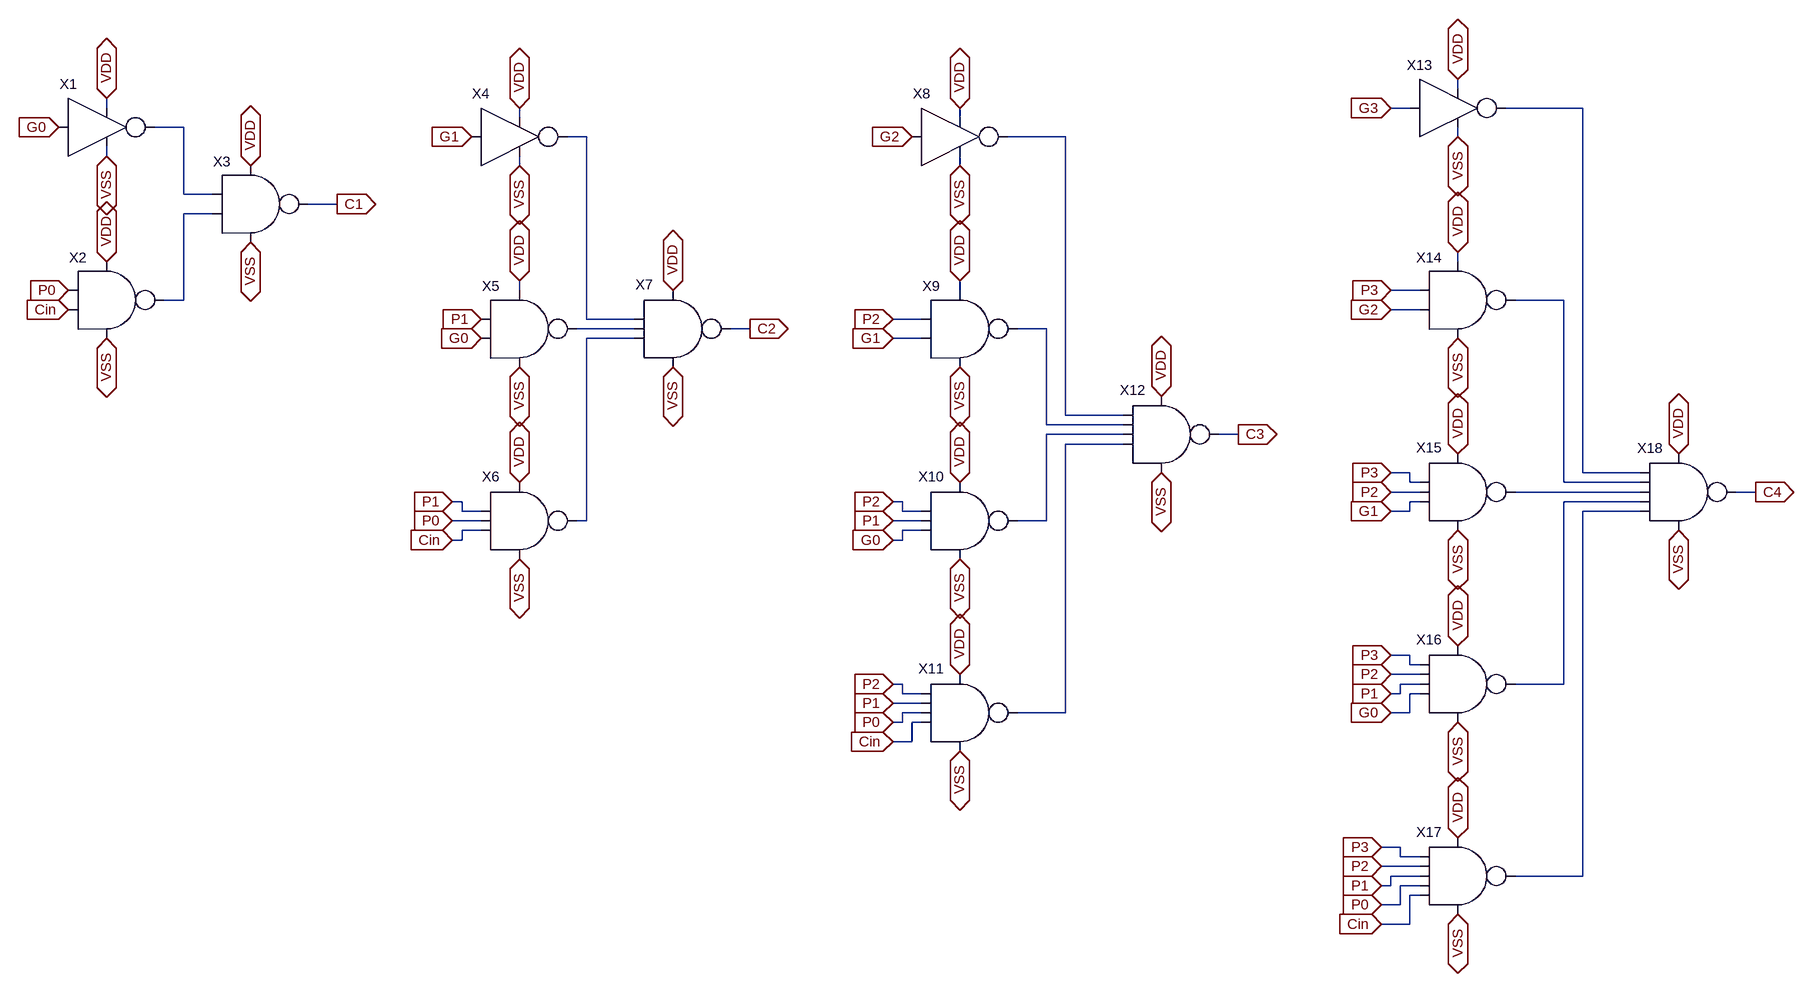
[diagram p0: schematic CLA_ADDER.asc]
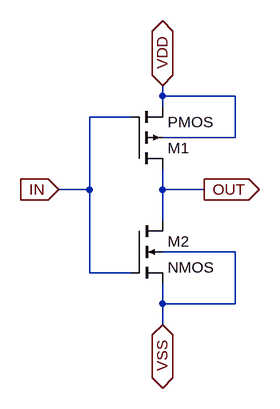
[diagram p1: sub-circuit inverter.asc]
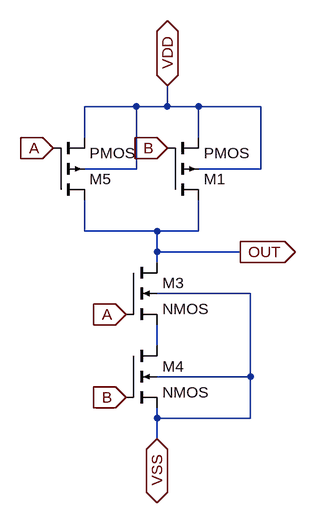
[diagram p2: sub-circuit nand2.asc]
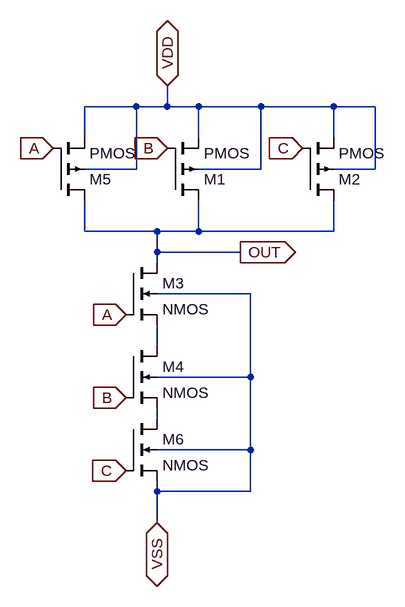
[diagram p3: sub-circuit nand3.asc]
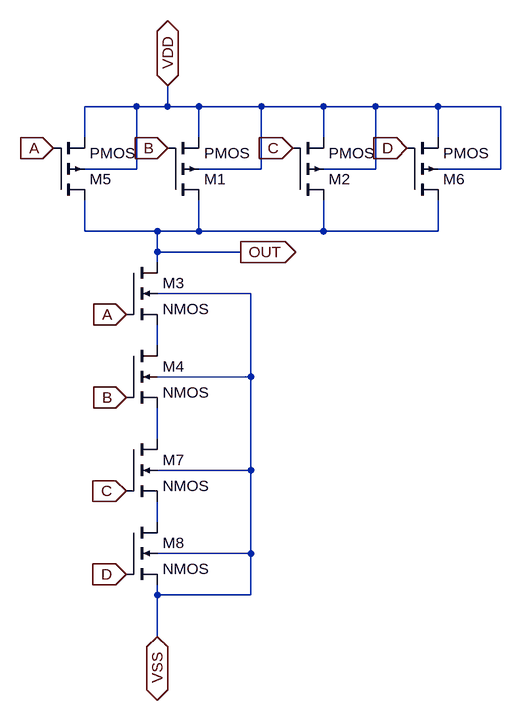
[diagram p4: sub-circuit nand4.asc]
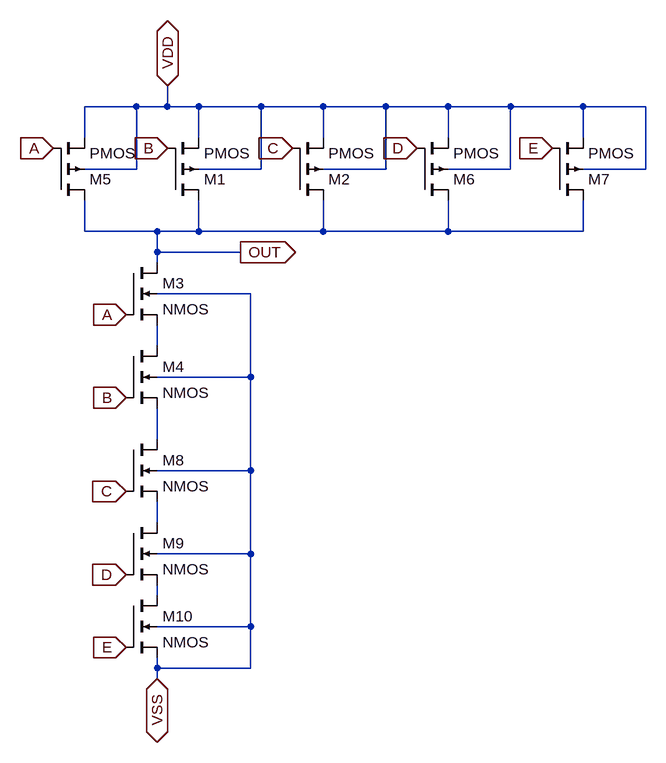
[diagram p5: sub-circuit nand5.asc]
CLA_ADDER.asc, the LTspice schematic file:
Version 4.1
SHEET 1 3272 1288
WIRE 2640 -192 2640 -208
WIRE 64 -160 64 -176
WIRE 2560 -160 2528 -160
WIRE 2848 -160 2720 -160
WIRE 752 -144 752 -160
WIRE 1648 -144 1648 -160
WIRE 192 -128 144 -128
WIRE 864 -112 832 -112
WIRE 1824 -112 1728 -112
WIRE 2640 -112 2640 -128
WIRE 64 -80 64 -96
WIRE 752 -64 752 -80
WIRE 1648 -64 1648 -80
WIRE 192 -16 192 -128
WIRE 240 -16 192 -16
WIRE 448 0 400 0
WIRE 240 16 192 16
WIRE 2640 96 2640 80
WIRE 752 144 752 128
WIRE 1648 144 1648 128
WIRE 2576 144 2528 144
WIRE 192 160 192 16
WIRE 192 160 160 160
WIRE 2816 160 2736 160
WIRE 2576 176 2528 176
WIRE 864 192 864 -112
WIRE 944 192 864 192
WIRE 1584 192 1536 192
WIRE 944 208 848 208
WIRE 1136 208 1104 208
WIRE 1792 208 1744 208
WIRE 944 224 864 224
WIRE 1584 224 1536 224
WIRE 1824 352 1824 -112
WIRE 1920 352 1824 352
WIRE 1792 368 1792 208
WIRE 1920 368 1792 368
WIRE 1920 384 1792 384
WIRE 2112 384 2080 384
WIRE 1920 400 1824 400
WIRE 2560 448 2528 448
WIRE 2848 448 2848 -160
WIRE 2944 448 2848 448
WIRE 2560 464 2560 448
WIRE 2576 464 2560 464
WIRE 2816 464 2816 160
WIRE 2944 464 2816 464
WIRE 2576 480 2528 480
WIRE 2944 480 2736 480
WIRE 3136 480 3104 480
WIRE 656 496 640 496
WIRE 1552 496 1536 496
WIRE 2576 496 2560 496
WIRE 2944 496 2816 496
WIRE 656 512 656 496
WIRE 688 512 656 512
WIRE 1552 512 1552 496
WIRE 1584 512 1552 512
WIRE 2560 512 2560 496
WIRE 2560 512 2528 512
WIRE 2944 512 2848 512
WIRE 688 528 640 528
WIRE 864 528 864 224
WIRE 864 528 848 528
WIRE 1584 528 1536 528
WIRE 1792 528 1792 384
WIRE 1792 528 1744 528
WIRE 688 544 656 544
WIRE 1584 544 1552 544
WIRE 656 560 656 544
WIRE 656 560 640 560
WIRE 1552 560 1552 544
WIRE 1552 560 1536 560
WIRE 2560 752 2528 752
WIRE 2560 768 2560 752
WIRE 2576 768 2560 768
WIRE 2576 784 2528 784
WIRE 1552 800 1536 800
WIRE 2576 800 2544 800
WIRE 2816 800 2816 496
WIRE 2816 800 2736 800
WIRE 1552 816 1552 800
WIRE 1584 816 1552 816
WIRE 2544 816 2544 800
WIRE 2544 816 2528 816
WIRE 2576 816 2560 816
WIRE 1584 832 1536 832
WIRE 1584 848 1552 848
WIRE 1824 848 1824 400
WIRE 1824 848 1744 848
WIRE 2560 848 2560 816
WIRE 2560 848 2528 848
WIRE 1552 864 1552 848
WIRE 1552 864 1536 864
WIRE 1584 864 1568 864
WIRE 1568 896 1568 864
WIRE 1568 896 1536 896
WIRE 2544 1072 2512 1072
WIRE 2544 1088 2544 1072
WIRE 2576 1088 2544 1088
WIRE 2576 1104 2512 1104
WIRE 2576 1120 2528 1120
WIRE 2848 1120 2848 512
WIRE 2848 1120 2736 1120
WIRE 2528 1136 2528 1120
WIRE 2528 1136 2512 1136
WIRE 2576 1136 2544 1136
WIRE 2576 1152 2560 1152
WIRE 2544 1168 2544 1136
WIRE 2544 1168 2512 1168
WIRE 2560 1200 2560 1152
WIRE 2560 1200 2512 1200
FLAG 64 -176 VDD
IOPIN 64 -176 BiDir
FLAG 64 96 VDD
IOPIN 64 96 BiDir
FLAG 304 -64 VDD
IOPIN 304 -64 BiDir
FLAG 304 64 VSS
IOPIN 304 64 BiDir
FLAG 64 224 VSS
IOPIN 64 224 BiDir
FLAG 64 -80 VSS
IOPIN 64 -80 BiDir
FLAG 752 -160 VDD
IOPIN 752 -160 BiDir
FLAG 752 128 VDD
IOPIN 752 128 BiDir
FLAG 752 464 VDD
IOPIN 752 464 BiDir
FLAG 752 -64 VSS
IOPIN 752 -64 BiDir
FLAG 752 272 VSS
IOPIN 752 272 BiDir
FLAG 752 592 VSS
IOPIN 752 592 BiDir
FLAG 1008 144 VDD
IOPIN 1008 144 BiDir
FLAG 1008 272 VSS
IOPIN 1008 272 BiDir
FLAG 1648 -160 VDD
IOPIN 1648 -160 BiDir
FLAG 1648 128 VDD
IOPIN 1648 128 BiDir
FLAG 1648 464 VDD
IOPIN 1648 464 BiDir
FLAG 1648 -64 VSS
IOPIN 1648 -64 BiDir
FLAG 1648 272 VSS
IOPIN 1648 272 BiDir
FLAG 1648 592 VSS
IOPIN 1648 592 BiDir
FLAG 1648 784 VDD
IOPIN 1648 784 BiDir
FLAG 1648 912 VSS
IOPIN 1648 912 BiDir
FLAG 1984 320 VDD
IOPIN 1984 320 BiDir
FLAG 1984 448 VSS
IOPIN 1984 448 BiDir
FLAG 2640 -208 VDD
IOPIN 2640 -208 BiDir
FLAG 2640 80 VDD
IOPIN 2640 80 BiDir
FLAG 2640 416 VDD
IOPIN 2640 416 BiDir
FLAG 2640 -112 VSS
IOPIN 2640 -112 BiDir
FLAG 2640 224 VSS
IOPIN 2640 224 BiDir
FLAG 2640 544 VSS
IOPIN 2640 544 BiDir
FLAG 2640 736 VDD
IOPIN 2640 736 BiDir
FLAG 2640 864 VSS
IOPIN 2640 864 BiDir
FLAG 2640 1056 VDD
IOPIN 2640 1056 BiDir
FLAG 2640 1184 VSS
IOPIN 2640 1184 BiDir
FLAG 3008 416 VDD
IOPIN 3008 416 BiDir
FLAG 3008 544 VSS
IOPIN 3008 544 BiDir
FLAG -16 -128 G0
IOPIN -16 -128 In
FLAG 0 144 P0
IOPIN 0 144 In
FLAG 0 176 Cin
IOPIN 0 176 In
FLAG 448 0 C1
IOPIN 448 0 Out
FLAG 1136 208 C2
IOPIN 1136 208 Out
FLAG 2112 384 C3
IOPIN 2112 384 Out
FLAG 3136 480 C4
IOPIN 3136 480 Out
FLAG 672 -112 G1
IOPIN 672 -112 In
FLAG 688 192 P1
IOPIN 688 192 In
FLAG 688 224 G0
IOPIN 688 224 In
FLAG 640 496 P1
IOPIN 640 496 In
FLAG 640 528 P0
IOPIN 640 528 In
FLAG 640 560 Cin
IOPIN 640 560 In
FLAG 1536 496 P2
IOPIN 1536 496 In
FLAG 1536 528 P1
IOPIN 1536 528 In
FLAG 1536 560 G0
IOPIN 1536 560 In
FLAG 1536 832 P1
IOPIN 1536 832 In
FLAG 1536 864 P0
IOPIN 1536 864 In
FLAG 1536 896 Cin
IOPIN 1536 896 In
FLAG 1536 800 P2
IOPIN 1536 800 In
FLAG 1536 192 P2
IOPIN 1536 192 In
FLAG 1536 224 G1
IOPIN 1536 224 In
FLAG 1568 -112 G2
IOPIN 1568 -112 In
FLAG 2528 448 P3
IOPIN 2528 448 In
FLAG 2528 480 P2
IOPIN 2528 480 In
FLAG 2528 512 G1
IOPIN 2528 512 In
FLAG 2528 784 P2
IOPIN 2528 784 In
FLAG 2528 816 P1
IOPIN 2528 816 In
FLAG 2528 848 G0
IOPIN 2528 848 In
FLAG 2528 752 P3
IOPIN 2528 752 In
FLAG 2528 144 P3
IOPIN 2528 144 In
FLAG 2528 176 G2
IOPIN 2528 176 In
FLAG 2528 -160 G3
IOPIN 2528 -160 In
FLAG 2512 1104 P2
IOPIN 2512 1104 In
FLAG 2512 1136 P1
IOPIN 2512 1136 In
FLAG 2512 1168 P0
IOPIN 2512 1168 In
FLAG 2512 1072 P3
IOPIN 2512 1072 In
FLAG 2512 1200 Cin
IOPIN 2512 1200 In
SYMBOL INVERTER 48 -128 R0
SYMATTR InstName X1
SYMBOL NAND2 64 160 R0
SYMATTR InstName X2
SYMBOL NAND2 304 0 R0
SYMATTR InstName X3
SYMBOL INVERTER 736 -112 R0
SYMATTR InstName X4
SYMBOL NAND2 752 208 R0
SYMATTR InstName X5
SYMBOL NAND3 752 528 R0
SYMATTR InstName X6
SYMBOL NAND3 1008 208 R0
SYMATTR InstName X7
SYMBOL INVERTER 1632 -112 R0
SYMATTR InstName X8
SYMBOL NAND2 1648 208 R0
SYMATTR InstName X9
SYMBOL NAND3 1648 528 R0
SYMATTR InstName X10
SYMBOL NAND4 1648 848 R0
SYMATTR InstName X11
SYMBOL NAND4 1984 384 R0
SYMATTR InstName X12
SYMBOL INVERTER 2624 -160 R0
SYMATTR InstName X13
SYMBOL NAND2 2640 160 R0
SYMATTR InstName X14
SYMBOL NAND3 2640 480 R0
SYMATTR InstName X15
SYMBOL NAND4 2640 800 R0
SYMATTR InstName X16
SYMBOL NAND5 2640 1120 R0
SYMATTR InstName X17
SYMBOL NAND5 3008 480 R0
SYMATTR InstName X18

inverter.asc, the sub-circuit schematic file:
Version 4.1
SHEET 1 880 680
WIRE 240 -272 240 -288
WIRE 352 -272 240 -272
WIRE 240 -256 240 -272
WIRE 192 -240 128 -240
WIRE 352 -208 352 -272
WIRE 352 -208 240 -208
WIRE 128 -128 128 -240
WIRE 128 -128 80 -128
WIRE 240 -128 240 -160
WIRE 304 -128 240 -128
WIRE 240 -80 240 -128
WIRE 352 -32 240 -32
WIRE 128 0 128 -128
WIRE 192 0 128 0
WIRE 240 48 240 16
WIRE 352 48 352 -32
WIRE 352 48 240 48
WIRE 240 80 240 48
FLAG 240 -288 VDD
IOPIN 240 -288 BiDir
FLAG 80 -128 IN
IOPIN 80 -128 In
FLAG 304 -128 OUT
IOPIN 304 -128 Out
FLAG 240 80 VSS
IOPIN 240 80 BiDir
SYMBOL pmos4 192 -160 M180
SYMATTR InstName M1
SYMBOL nmos4 192 -80 R0
SYMATTR InstName M2

nand2.asc, the sub-circuit schematic file:
Version 4.1
SHEET 1 880 680
WIRE 160 -688 80 -688
WIRE 208 -688 208 -720
WIRE 208 -688 160 -688
WIRE 256 -688 208 -688
WIRE 352 -688 256 -688
WIRE 80 -640 80 -688
WIRE 256 -640 256 -688
WIRE 160 -592 160 -688
WIRE 160 -592 80 -592
WIRE 352 -592 352 -688
WIRE 352 -592 256 -592
WIRE 80 -496 80 -544
WIRE 192 -496 80 -496
WIRE 256 -496 256 -544
WIRE 256 -496 192 -496
WIRE 192 -464 192 -496
WIRE 320 -464 192 -464
WIRE 192 -448 192 -464
WIRE 336 -400 192 -400
WIRE 192 -320 192 -352
WIRE 336 -272 336 -400
WIRE 336 -272 192 -272
WIRE 192 -208 192 -224
WIRE 336 -208 336 -272
WIRE 336 -208 192 -208
WIRE 192 -176 192 -208
FLAG 208 -720 VDD
IOPIN 208 -720 BiDir
FLAG 192 -176 VSS
IOPIN 192 -176 BiDir
FLAG 32 -624 A
IOPIN 32 -624 In
FLAG 208 -624 B
IOPIN 208 -624 In
FLAG 144 -368 A
IOPIN 144 -368 In
FLAG 144 -240 B
IOPIN 144 -240 In
FLAG 320 -464 OUT
IOPIN 320 -464 Out
SYMBOL nmos4 144 -448 R0
SYMATTR InstName M3
SYMBOL nmos4 144 -320 R0
SYMATTR InstName M4
SYMBOL pmos4 32 -544 M180
SYMATTR InstName M5
SYMBOL pmos4 208 -544 M180
SYMATTR InstName M1

nand3.asc, the sub-circuit schematic file:
Version 4.1
SHEET 1 880 680
WIRE 160 -688 80 -688
WIRE 208 -688 208 -720
WIRE 208 -688 160 -688
WIRE 256 -688 208 -688
WIRE 352 -688 256 -688
WIRE 464 -688 352 -688
WIRE 528 -688 464 -688
WIRE 80 -640 80 -688
WIRE 256 -640 256 -688
WIRE 464 -640 464 -688
WIRE 160 -592 160 -688
WIRE 160 -592 80 -592
WIRE 352 -592 352 -688
WIRE 352 -592 256 -592
WIRE 528 -592 528 -688
WIRE 528 -592 464 -592
WIRE 80 -496 80 -544
WIRE 192 -496 80 -496
WIRE 256 -496 256 -544
WIRE 256 -496 192 -496
WIRE 464 -496 464 -544
WIRE 464 -496 256 -496
WIRE 192 -464 192 -496
WIRE 320 -464 192 -464
WIRE 192 -448 192 -464
WIRE 336 -400 192 -400
WIRE 192 -320 192 -352
WIRE 336 -272 336 -400
WIRE 336 -272 192 -272
WIRE 192 -208 192 -224
WIRE 336 -160 336 -272
WIRE 336 -160 192 -160
WIRE 192 -96 192 -112
WIRE 336 -96 336 -160
WIRE 336 -96 192 -96
WIRE 192 -48 192 -96
FLAG 208 -720 VDD
IOPIN 208 -720 BiDir
FLAG 192 -48 VSS
IOPIN 192 -48 BiDir
FLAG 32 -624 A
IOPIN 32 -624 In
FLAG 208 -624 B
IOPIN 208 -624 In
FLAG 144 -368 A
IOPIN 144 -368 In
FLAG 144 -240 B
IOPIN 144 -240 In
FLAG 320 -464 OUT
IOPIN 320 -464 Out
FLAG 416 -624 C
IOPIN 416 -624 In
FLAG 144 -128 C
IOPIN 144 -128 In
SYMBOL nmos4 144 -448 R0
SYMATTR InstName M3
SYMBOL nmos4 144 -320 R0
SYMATTR InstName M4
SYMBOL pmos4 32 -544 M180
SYMATTR InstName M5
SYMBOL pmos4 208 -544 M180
SYMATTR InstName M1
SYMBOL pmos4 416 -544 M180
SYMATTR InstName M2
SYMBOL nmos4 144 -208 R0
SYMATTR InstName M6

nand4.asc, the sub-circuit schematic file:
Version 4.1
SHEET 1 880 680
WIRE 160 -688 80 -688
WIRE 208 -688 208 -720
WIRE 208 -688 160 -688
WIRE 256 -688 208 -688
WIRE 352 -688 256 -688
WIRE 448 -688 352 -688
WIRE 528 -688 448 -688
WIRE 624 -688 528 -688
WIRE 720 -688 624 -688
WIRE 80 -640 80 -688
WIRE 256 -640 256 -688
WIRE 448 -640 448 -688
WIRE 624 -640 624 -688
WIRE 160 -592 160 -688
WIRE 160 -592 80 -592
WIRE 352 -592 352 -688
WIRE 352 -592 256 -592
WIRE 528 -592 528 -688
WIRE 528 -592 448 -592
WIRE 720 -592 720 -688
WIRE 720 -592 624 -592
WIRE 80 -496 80 -544
WIRE 192 -496 80 -496
WIRE 256 -496 256 -544
WIRE 256 -496 192 -496
WIRE 448 -496 448 -544
WIRE 448 -496 256 -496
WIRE 624 -496 624 -544
WIRE 624 -496 448 -496
WIRE 192 -464 192 -496
WIRE 320 -464 192 -464
WIRE 192 -448 192 -464
WIRE 336 -400 192 -400
WIRE 192 -320 192 -352
WIRE 336 -272 336 -400
WIRE 336 -272 192 -272
WIRE 192 -176 192 -224
WIRE 336 -128 336 -272
WIRE 336 -128 192 -128
WIRE 192 -48 192 -80
WIRE 336 0 336 -128
WIRE 336 0 192 0
WIRE 192 64 192 48
WIRE 336 64 336 0
WIRE 336 64 192 64
WIRE 192 128 192 64
FLAG 208 -720 VDD
IOPIN 208 -720 BiDir
FLAG 192 128 VSS
IOPIN 192 128 BiDir
FLAG 32 -624 A
IOPIN 32 -624 In
FLAG 208 -624 B
IOPIN 208 -624 In
FLAG 144 -368 A
IOPIN 144 -368 In
FLAG 144 -240 B
IOPIN 144 -240 In
FLAG 320 -464 OUT
IOPIN 320 -464 Out
FLAG 400 -624 C
IOPIN 400 -624 In
FLAG 576 -624 D
IOPIN 576 -624 In
FLAG 144 -96 C
IOPIN 144 -96 In
FLAG 144 32 D
IOPIN 144 32 In
SYMBOL nmos4 144 -448 R0
SYMATTR InstName M3
SYMBOL nmos4 144 -320 R0
SYMATTR InstName M4
SYMBOL pmos4 32 -544 M180
SYMATTR InstName M5
SYMBOL pmos4 208 -544 M180
SYMATTR InstName M1
SYMBOL pmos4 400 -544 M180
SYMATTR InstName M2
SYMBOL pmos4 576 -544 M180
SYMATTR InstName M6
SYMBOL nmos4 144 -176 R0
SYMATTR InstName M7
SYMBOL nmos4 144 -48 R0
SYMATTR InstName M8

nand5.asc, the sub-circuit schematic file:
Version 4.1
SHEET 1 948 680
WIRE 160 -688 80 -688
WIRE 208 -688 208 -720
WIRE 208 -688 160 -688
WIRE 256 -688 208 -688
WIRE 352 -688 256 -688
WIRE 448 -688 352 -688
WIRE 544 -688 448 -688
WIRE 640 -688 544 -688
WIRE 736 -688 640 -688
WIRE 848 -688 736 -688
WIRE 944 -688 848 -688
WIRE 80 -640 80 -688
WIRE 256 -640 256 -688
WIRE 448 -640 448 -688
WIRE 640 -640 640 -688
WIRE 848 -640 848 -688
WIRE 160 -592 160 -688
WIRE 160 -592 80 -592
WIRE 352 -592 352 -688
WIRE 352 -592 256 -592
WIRE 544 -592 544 -688
WIRE 544 -592 448 -592
WIRE 736 -592 736 -688
WIRE 736 -592 640 -592
WIRE 944 -592 944 -688
WIRE 944 -592 848 -592
WIRE 80 -496 80 -544
WIRE 192 -496 80 -496
WIRE 256 -496 256 -544
WIRE 256 -496 192 -496
WIRE 448 -496 448 -544
WIRE 448 -496 256 -496
WIRE 640 -496 640 -544
WIRE 640 -496 448 -496
WIRE 848 -496 848 -544
WIRE 848 -496 640 -496
WIRE 192 -464 192 -496
WIRE 320 -464 192 -464
WIRE 192 -448 192 -464
WIRE 336 -400 192 -400
WIRE 192 -320 192 -352
WIRE 336 -272 336 -400
WIRE 336 -272 192 -272
WIRE 192 -176 192 -224
WIRE 336 -128 336 -272
WIRE 336 -128 192 -128
WIRE 192 -48 192 -80
WIRE 336 0 336 -128
WIRE 336 0 192 0
WIRE 192 64 192 48
WIRE 336 112 336 0
WIRE 336 112 192 112
WIRE 192 176 192 160
WIRE 336 176 336 112
WIRE 336 176 192 176
WIRE 192 192 192 176
FLAG 208 -720 VDD
IOPIN 208 -720 BiDir
FLAG 192 192 VSS
IOPIN 192 192 BiDir
FLAG 32 -624 A
IOPIN 32 -624 In
FLAG 208 -624 B
IOPIN 208 -624 In
FLAG 144 -368 A
IOPIN 144 -368 In
FLAG 144 -240 B
IOPIN 144 -240 In
FLAG 320 -464 OUT
IOPIN 320 -464 Out
FLAG 400 -624 C
IOPIN 400 -624 In
FLAG 592 -624 D
IOPIN 592 -624 In
FLAG 800 -624 E
IOPIN 800 -624 In
FLAG 144 -96 C
IOPIN 144 -96 In
FLAG 144 32 D
IOPIN 144 32 In
FLAG 144 144 E
IOPIN 144 144 In
SYMBOL nmos4 144 -448 R0
SYMATTR InstName M3
SYMBOL nmos4 144 -320 R0
SYMATTR InstName M4
SYMBOL pmos4 32 -544 M180
SYMATTR InstName M5
SYMBOL pmos4 208 -544 M180
SYMATTR InstName M1
SYMBOL pmos4 400 -544 M180
SYMATTR InstName M2
SYMBOL pmos4 592 -544 M180
SYMATTR InstName M6
SYMBOL pmos4 800 -544 M180
SYMATTR InstName M7
SYMBOL nmos4 144 -176 R0
SYMATTR InstName M8
SYMBOL nmos4 144 -48 R0
SYMATTR InstName M9
SYMBOL nmos4 144 64 R0
SYMATTR InstName M10

The netlist it stands for:
* CLA_ADDER.asc
X§X1 G0 N002 VDD VSS inverter
X§X2 P0 Cin N005 VDD VSS nand2
X§X3 N002 N005 C1 VDD VSS nand2
X§X4 G1 N003 VDD VSS inverter
X§X5 P1 G0 N007 VDD VSS nand2
X§X6 P1 P0 Cin N009 VDD VSS nand3
X§X7 N003 N007 N009 C2 VDD VSS nand3
X§X8 G2 N004 VDD VSS inverter
X§X9 P2 G1 N008 VDD VSS nand2
X§X10 P2 P1 G0 N010 VDD VSS nand3
X§X11 P2 P1 P0 Cin N011 VDD VSS nand4
X§X12 N004 N008 N010 N011 C3 VDD VSS nand4
X§X13 G3 N001 VDD VSS inverter
X§X14 P3 G2 N006 VDD VSS nand2
X§X15 P3 P2 G1 N012 VDD VSS nand3
X§X16 P3 P2 P1 G0 N013 VDD VSS nand4
X§X17 P3 P2 P1 P0 Cin N014 VDD VSS nand5
X§X18 N001 N006 N012 N013 N014 C4 VDD VSS nand5

* block symbol definitions
.subckt inverter IN OUT VDD VSS
M1 OUT IN VDD VDD PMOS
M2 OUT IN VSS VSS NMOS
.ends inverter

.subckt nand2 A B OUT VDD VSS
M3 OUT A N001 VSS NMOS
M4 N001 B VSS VSS NMOS
M5 OUT A VDD VDD PMOS
M1 OUT B VDD VDD PMOS
.ends nand2

.subckt nand3 A B C OUT VDD VSS
M3 OUT A N001 VSS NMOS
M4 N001 B N002 VSS NMOS
M5 OUT A VDD VDD PMOS
M1 OUT B VDD VDD PMOS
M2 OUT C VDD VDD PMOS
M6 N002 C VSS VSS NMOS
.ends nand3

.subckt nand4 A B C D OUT VDD VSS
M3 OUT A N001 VSS NMOS
M4 N001 B N002 VSS NMOS
M5 OUT A VDD VDD PMOS
M1 OUT B VDD VDD PMOS
M2 OUT C VDD VDD PMOS
M6 OUT D VDD VDD PMOS
M7 N002 C N003 VSS NMOS
M8 N003 D VSS VSS NMOS
.ends nand4

.subckt nand5 A B C D E OUT VDD VSS
M3 OUT A N001 VSS NMOS
M4 N001 B N002 VSS NMOS
M5 OUT A VDD VDD PMOS
M1 OUT B VDD VDD PMOS
M2 OUT C VDD VDD PMOS
M6 OUT D VDD VDD PMOS
M7 OUT E VDD VDD PMOS
M8 N002 C N003 VSS NMOS
M9 N003 D N004 VSS NMOS
M10 N004 E VSS VSS NMOS
.ends nand5

.model NMOS NMOS
.model PMOS PMOS
.lib standard.mos
.backanno
.end